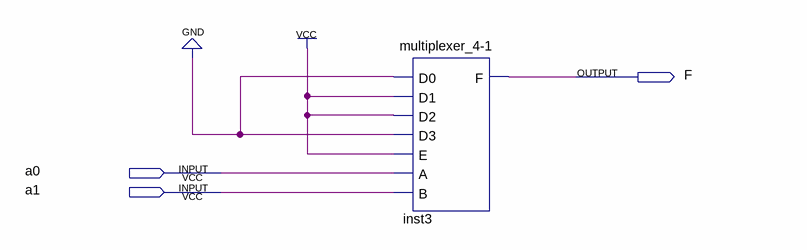
[diagram p0: schematic sheet]
// Quartus schematic 2args.bdf as structural Verilog: 1 symbols, 3 pins
module \2args  (
  input  a0,
  input  a1,
  output F
);

  \multiplexer_4-1  inst3 (.D0(1'b0), .D1(1'b1), .D2(1'b1), .D3(1'b0), .E(1'b1), .A(a0), .B(a1), .F(F));
endmodule
